# Altium schematic sheet POWER.SchDoc: POWER
size A4; Author: Silvio Navaretti; CompanyName: Arduino srl; DocumentNumber: ABX00063; Revision: V1.4; SheetNumber: 4; SheetTotal: 8; RevAuthor: Silvio Navaretti
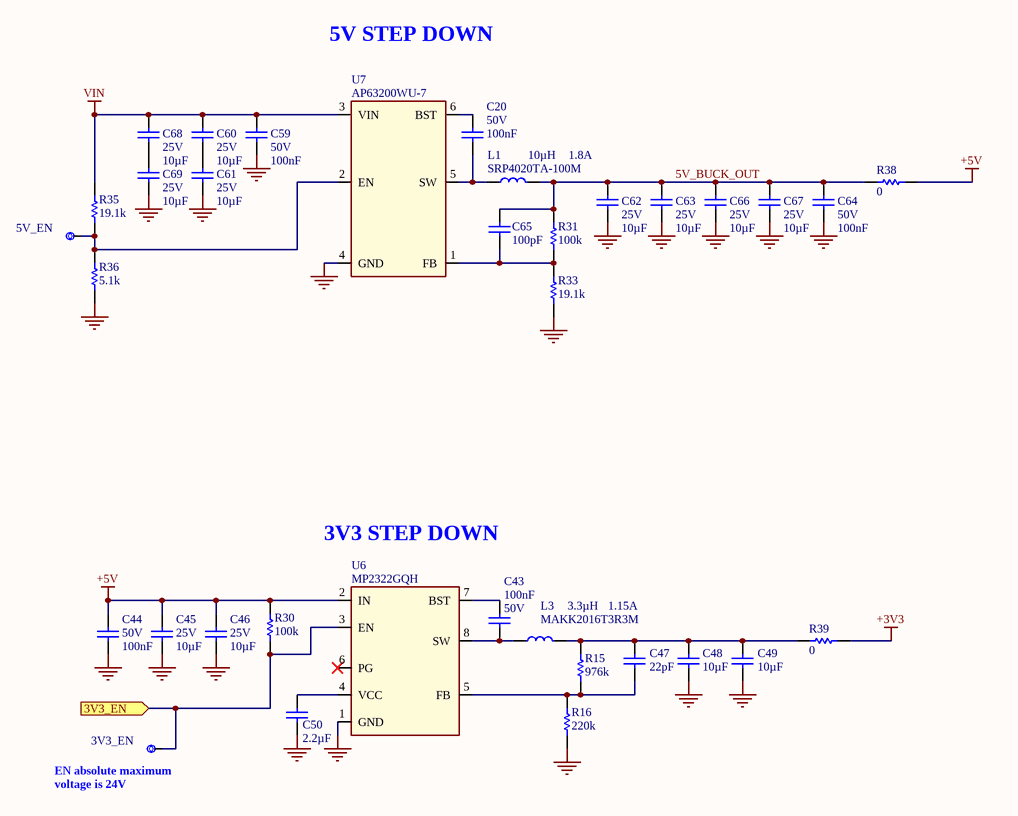
[diagram p0: POWER.SchDoc]

## Parts
3V3_EN  CMP-018-0005-A.3  [TP-1.00MM]  (value not drawn)  (no BOM)
5V_EN  CMP-018-0005-A.3  [TP-1.00MM]  (value not drawn)  (no BOM)
C20  value 100nF  Voltage: 50V  [CAP-0402]  (hidden comment: GRM155R61H104KE19D)
C43  value 100nF  Voltage: 50V  [CAP-0402]  (hidden comment: GRM155R61H104KE19D)
C44  value 100nF  Voltage: 50V  [CAP-0402]  (hidden comment: GRM155R61H104KE19D)
C45  value 10µF  Voltage: 25V  [CAP-0603]  (hidden comment: C1608A106M250NT)
C46  value 10µF  Voltage: 25V  [CAP-0603]  (hidden comment: C1608A106M250NT)
C47  value 22pF  [CAP-0402]  (hidden comment: 0402N220J500CT)
C48  value 10µF  [CAP-0603]  (hidden comment: C1608A106M250NT)
C49  value 10µF  [CAP-0603]  (hidden comment: C1608A106M250NT)
C50  value 2.2µF  [CAP-0402]  (hidden comment: GRM155R60J225KE95D)
C59  value 100nF  Voltage: 50V  [CAP-0402]  (hidden comment: GRM155R61H104KE19D)
C60  value 10µF  Voltage: 25V  [CAP-0603]  (hidden comment: C1608A106M250NT)
C61  value 10µF  Voltage: 25V  [CAP-0603]  (hidden comment: C1608A106M250NT)
C62  value 10µF  Voltage: 25V  [CAP-0603]  (hidden comment: C1608A106M250NT)
C63  value 10µF  Voltage: 25V  [CAP-0603]  (hidden comment: C1608A106M250NT)
C64  value 100nF  Voltage: 50V  [CAP-0402]  (hidden comment: GRM155R61H104KE19D)
C65  value 100pF  [CAP-0402]  (hidden comment: CC0402JRNPO9BN101)
C66  value 10µF  Voltage: 25V  [CAP-0603]  (hidden comment: C1608A106M250NT)
C67  value 10µF  Voltage: 25V  [CAP-0603]  (hidden comment: C1608A106M250NT)
C68  value 10µF  Voltage: 25V  [CAP-0603]  (hidden comment: C1608A106M250NT)
C69  value 10µF  Voltage: 25V  [CAP-0603]  (hidden comment: C1608A106M250NT)
L1  SRP4020TA-100M  Inductance: 10µH  Current: 1.8A  [SRP4020]
L3  MAKK2016T3R3M  Max DC Current: 1.15A  Inductance: 3.3µH  [MAKK2016T3R3M-Footprint-1]
R15  value 976k  [RES-0402]  (hidden comment: CRCW0402976KFKED)
R16  value 220k  [RES-0402]  (hidden comment: CRCW0402220KFKED)
R30  value 100k  [RES-0402]  (hidden comment: CRCW0402100KFKEDC)
R31  value 100k  [RES-0402]  (hidden comment: CRCW0402100KFKEDC)
R33  value 19.1k  [RES-0402]  (hidden comment: CRCW040219K1FKEDC)
R35  value 19.1k  [RES-0402]  (hidden comment: CRCW040219K1FKEDC)
R36  value 5.1k  [RES-0402]  (hidden comment: RC0402FR-075K1L)
R38  value 0  [RES-0402]  (hidden comment: CRCW04020000Z0EDC)
R39  value 0  [RES-0402]  (hidden comment: CRCW04020000Z0EDC)
U6  MP2322GQH  [QFN50P150X200X90-8L]
U7  AP63200WU-7  [SOT95P280X100-6N]

## Ports
3V3_EN (in)

## Nets
+3V3: R39.2
+5V: C44.1 C45.2 C46.2 R30.1 R38.2 U6.2(IN)
GND: C44.2 C45.1 C46.1 C48.1 C49.1 C50.1 C59.2 C61.1 C62.1 C63.1 C64.2 C66.1 C67.1 C69.1 R16.1 R33.1 R36.2 U6.1(GND) U7.4(GND)
VIN: C59.1 C60.2 C68.2 R35.1 U7.3(VIN)
3V3_EN: 3V3_EN.X R30.2 U6.3(EN) ; port 3V3_EN
5V_BUCK_OUT: C62.2 C63.2 C64.1 C65.2 C66.2 C67.2 L1.2 R31.1 R38.1
Net5V_EN_X: 5V_EN.X R35.2 R36.1 U7.2(EN)
NetC20_1: C20.1 U7.6(BST)
NetC20_2: C20.2 L1.1 U7.5(SW)
NetC43_1: C43.1 L3.1 U6.8(SW)
NetC43_2: C43.2 U6.7(BST)
NetC47_1: C47.1 R15.1 R16.2 U6.5(FB)
NetC47_2: C47.2 C48.2 C49.2 L3.2 R15.2 R39.1
NetC50_2: C50.2 U6.4(VCC)
NetC60_1: C60.1 C61.2
NetC65_1: C65.1 R31.2 R33.2 U7.1(FB)
NetC68_1: C68.1 C69.2

Not connected (* = marked no-connect by the designer): U6 6(PG)*

## Notes on the sheet
- 5V STEP DOWN
- 3V3 STEP DOWN
- (near 3V3_EN) EN absolute maximum voltage is 24V
- Title:
- ID:
- Date:
- Time:
- Version:
- Sheet
- of
- RevAuthor:
- Reference Designs ARE PROVIDED "AS IS" AND "WITH ALL FAULTS. Arduino SA DISCLAIMS ALL OTHER WARRANTIES, EXPRESS OR IMPLIED, REGARDING PRODUCTS, INCLUDING BUT NOT LIMITED TO, ANY IMPLIED WARRANTIES OF MERCHANTABILITY OR FITNESS FOR A PARTICULAR PURPOSE.
  Arduino SA may make changes to specifications and product descriptions at any time, without notice. The Customer must not rely on the absence or characteristics of any features or instructions marked "reserved" or "undefined". Arduino SA reserves these for future definition and shall have no responsibility whatsoever for conflicts or incompatibilities arising from future changes to them. The product information on the Web Site or Materials is subject to change without notice.
  Do not finalize a design with this info. ARDUINO and other Arduino brands and logos and Trademarks of Arduino SA. All Arduino SA Trademarks cannot be used without owner's formal permission.
- File:
- Author:

## Library data of the parts
3V3_EN 5V_EN = UT0013-A.4: Test point 1.00mm; Design Item ID: CMP-018-0005-A.3; Source: ut.SchLib; Pin Count: 1
C20 C43 C44 C59 C64 = C0015-A.14: CAP CHIP 0402 100nF 10% 50V X5R; Manufacturer: Murata; Code Arduino: A5141; Part Number: GRM155R61H104KE19D; Tolerance: 10%; Dielectric: X5R; Case Code (Imperial): 0402; Technology: Ceramic
C45 C46 C48 C49 C60-C63 C66-C69 = C0047-A.18: CAP CHIP 0603 10uF 20% 25V X5R; Manufacturer: Hottech; Code Arduino: 2213; Manufacturer 2: Murata Electronics; Part Number: C1608A106M250NT; Dielectric: X5R; Tolerance: 20%; Case Code (Imperial): 0603; Part number 2: CL10A106MA8NRNC; Technology: Ceramic
  C48 C49: Voltage: 25V
C47 = C0029-A.14: CAP CHIP 0402 22pF 5% 50V C0G; Manufacturer: Walsin; Code Arduino: 0137; Case Code (Imperial): 0402; Tolerance: 5%; Part Number: 0402N220J500CT; Manufacturer 2: Murata Electronics; Voltage: 50V; Dielectric: C0G; Part number 3: C0402C220K5GAC7867; Part number 2: GRM1555C1H220JA01D; Manufacturer 3: KEMET; Technology: Ceramic
C50 = C0031-A.14: CAP CHIP 0402 2.2uF 10% 6.3V X5R; Manufacturer: Murata; Code Arduino: A5529; Tolerance: 10%; Voltage: 6.3V; Part Number: GRM155R60J225KE95D; Dielectric: X5R; Case Code (Imperial): 0402; Technology: Ceramic
C65 = C0013-A.4: CAP CHIP 0402 100pF 10% 50V C0G; Manufacturer: Yageo; Code Arduino: C0013; Tolerance: 5%; Case Code (Imperial): 0402; Dielectric: C0G; Voltage: 50V; Part Number: CC0402JRNPO9BN101; Technology: Ceramic
L1 = I0065-A.2: IND FIXED 10UH IRMS 1.8A ISAT 2.3A 243m ohm SMD 4.45x4mm; Manufacturer: Bourns; Value: 10u; Code Arduino: I0065; Part Number: SRP4020TA-100M; Device Type: Inductor
L3 = I0045-A.10: IND CHIP 0806 3.3 uH 20% 1.2A; Manufacturer: Taiyo Yuden; Core Material: Metal; DC Resistance (DCR): 255mR; Code Arduino: I0045; Test Frequency: 2MHz; Shielding: Shielded; Value: 3.3µH; Max Operating Temperature: 105°C; Height - Seated (Max): 0.039inch; Halogen Free: Halogen Free; Device Type: Inductor; Min Operating Temperature: -40°C; Length: 0.079inch; Packaging: Tape and Reel; Termination: SMD/SMT; Mount: Surface Mount; Height: 1mm; Manufacturer 2: Murata; Saturation Current: 1.15A; Part Number: MAKK2016T3R3M; Package Quantity: 3000; Case Code (Imperial): 0806; Manufacturer Part Number 2: LQM2MPN3R3NG0L; Width: 1.6mm; Tolerance: 20%; Resistor Type: Wirewound; Case Code (Metric): 2016; Case/Package: 0806; Current Rating: 1.2A
R15 = R0070-A.24: RES CHIP 0402 976k 1% 1/16W; Manufacturer: Vishay; Power: 62.5mW; Code Arduino: R0070; Temperature coefficient: 100ppm; Tolerance: 1%; Part Number: CRCW0402976KFKED; Case Code (Imperial): 0402; Technology: Thick film
R16 = R0028-A.23: RES CHIP 0402 220k 1% 1/16W; Manufacturer: Vishay; Code Arduino: 2334; Power: 62.5mW; Temperature coefficient: 200ppm; Part Number: CRCW0402220KFKED; Case Code (Imperial): 0402; Tolerance: 1%; Technology: Thick film
R30 R31 = R0001-A.23: RES CHIP 0402 100k 1% 1/16W; Manufacturer: Vishay; Power: 62.5mW; Code Arduino: 0134; Temperature coefficient: 100ppm; Part Number: CRCW0402100KFKEDC; Tolerance: 1%; Case Code (Imperial): 0402; Technology: Thick film
R33 = R0033-A.23: RES CHIP 0402 19k1 1% 1/16W; Manufacturer: Vishay; Code Arduino: A5369; Power: 62.5mW; Temperature coefficient: 100ppm; Tolerance: 1%; Part Number: CRCW040219K1FKEDC; Case Code (Imperial): 0402; Technology: Thick film
R35 = R0033-A.23: RES CHIP 0402 19k1 1% 1/16W; Manufacturer: Vishay; Power: 62.5mW; Code Arduino: A5369; Temperature coefficient: 100ppm; Part Number: CRCW040219K1FKEDC; Tolerance: 1%; Case Code (Imperial): 0402; Technology: Thick film
R36 = R0210-A.18: RES CHIP 0402 5k1 1% 1/16W; Manufacturer: YAGEO; Power: 63mW; Code Arduino: R0210; Temperature coefficient: 100ppm; Part Number: RC0402FR-075K1L; Tolerance: 1%; Case Code (Imperial): 0402; Technology: Thick film
R38 R39 = R0000-A.23: RES CHIP 0402 0R 1/16W; Manufacturer: Vishay; Power: 62.5mW; Tolerance: 0%; Code Arduino: 0039; Temperature coefficient: 0ppm; Part Number: CRCW04020000Z0EDC; Case Code (Imperial): 0402; Technology: Thick film
U6 = U0072-A.8: IC STEP DOWN CONV 1A 22V QFN8; Manufacturer: Monolithic Power Systems; Code Arduino: U0072; Part Number: MP2322GQH
U7 = U0241-A.6: IC BUCK VIN 3V8 to 32V Iout 4A duty 100% fsw 500kHz TSOT26; Manufacturer: Diodes Incorporated; Code Arduino: U0241; Part Number: AP63200WU-7